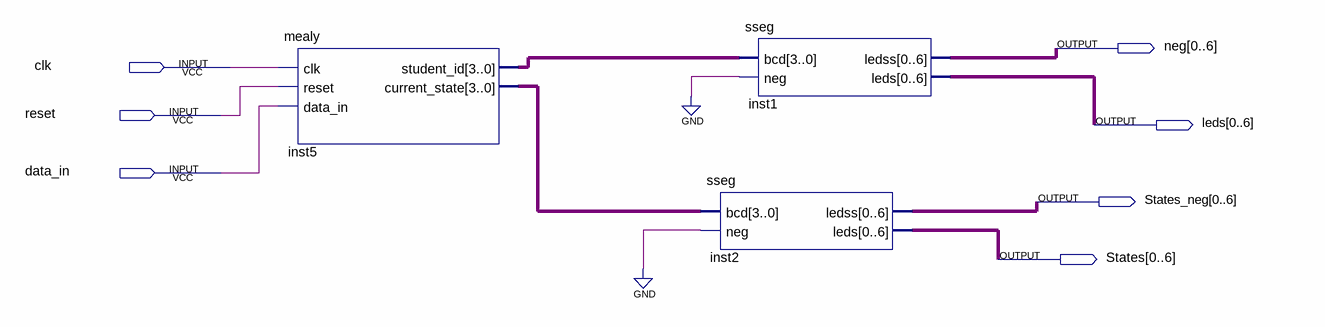
[diagram p0: schematic sheet]
// Quartus schematic lab5part2.bdf as structural Verilog: 3 symbols, 7 pins
module lab5part2 (
  input  clk,
  input  reset,
  input  data_in,
  output [0:6] neg,
  output [0:6] leds,
  output [0:6] States_neg,
  output [0:6] States
);

  wire [3:0] inst5_current_state, inst5_student_id;

  mealy inst5 (
    .clk(clk), .reset(reset), .data_in(data_in), .student_id(inst5_student_id),
    .current_state(inst5_current_state));
  sseg inst1 (.bcd(inst5_student_id), .neg(1'b0), .ledss(neg), .leds(leds));
  sseg inst2 (.bcd(inst5_current_state), .neg(1'b0), .ledss(States_neg), .leds(States));
endmodule
